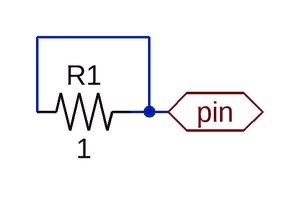
[diagram p0: schematic pin.asc]
pin.asc, the LTspice schematic file:
Version 4
SHEET 1 880 680
WIRE 32 160 -64 160
WIRE -64 224 -64 160
WIRE 32 224 32 160
WIRE 32 224 16 224
WIRE 48 224 32 224
FLAG 48 224 pin
IOPIN 48 224 BiDir
SYMBOL res 32 208 R90
WINDOW 0 0 56 VBottom 2
WINDOW 3 32 56 VTop 2
SYMATTR InstName R1
SYMATTR Value 1

The netlist it stands for:
* pin.asc
R1 pin pin 1
.backanno
.end